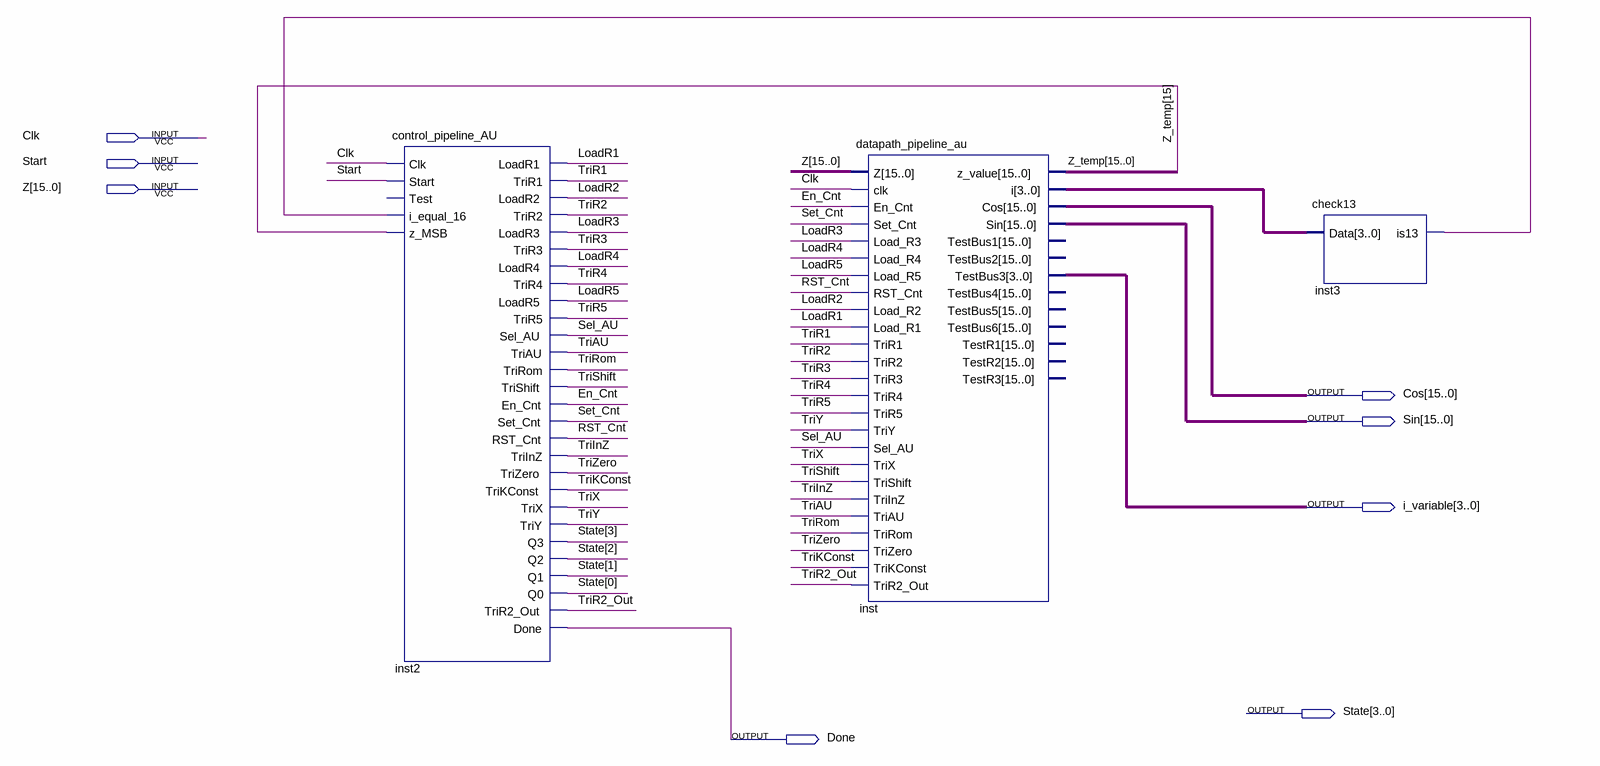
[diagram p0: schematic sheet]
// Quartus schematic CORDIC_ver2_pipeline_AU.bdf as structural Verilog: 3 symbols, 8 pins
module CORDIC_ver2_pipeline_AU (
  input  Clk,
  input  Start,
  input  [15:0] Z,
  output [15:0] Cos,
  output [15:0] Sin,
  output [3:0] i_variable,
  output [3:0] State,
  output Done
);

  wire En_Cnt, inst3_is13, LoadR1, LoadR2, LoadR3, LoadR4, LoadR5, RST_Cnt, Sel_AU, Set_Cnt, TriAU, TriInZ,
       TriKConst, TriR1, TriR2, TriR2_Out, TriR3, TriR4, TriR5, TriRom, TriShift, TriX, TriY, TriZero;
  wire [3:0] inst_i;
  wire [15:0] Z_temp;

  control_pipeline_AU inst2 (
    .Clk(Clk), .Start(Start), .i_equal_16(inst3_is13), .z_MSB(Z_temp[15]), .LoadR1(LoadR1), .TriR1(TriR1),
    .LoadR2(LoadR2), .TriR2(TriR2), .LoadR3(LoadR3), .TriR3(TriR3), .LoadR4(LoadR4), .TriR4(TriR4),
    .LoadR5(LoadR5), .TriR5(TriR5), .Sel_AU(Sel_AU), .TriAU(TriAU), .TriRom(TriRom), .TriShift(TriShift),
    .En_Cnt(En_Cnt), .Set_Cnt(Set_Cnt), .RST_Cnt(RST_Cnt), .TriInZ(TriInZ), .TriZero(TriZero),
    .TriKConst(TriKConst), .TriX(TriX), .TriY(TriY), .Q3(State[3]), .Q2(State[2]), .Q1(State[1]),
    .Q0(State[0]), .TriR2_Out(TriR2_Out), .Done(Done));  // open: Test
  datapath_pipeline_au inst (
    .Z(Z), .clk(Clk), .En_Cnt(En_Cnt), .Set_Cnt(Set_Cnt), .Load_R3(LoadR3), .Load_R4(LoadR4),
    .Load_R5(LoadR5), .RST_Cnt(RST_Cnt), .Load_R2(LoadR2), .Load_R1(LoadR1), .TriR1(TriR1), .TriR2(TriR2),
    .TriR3(TriR3), .TriR4(TriR4), .TriR5(TriR5), .TriY(TriY), .Sel_AU(Sel_AU), .TriX(TriX),
    .TriShift(TriShift), .TriInZ(TriInZ), .TriAU(TriAU), .TriRom(TriRom), .TriZero(TriZero),
    .TriKConst(TriKConst), .TriR2_Out(TriR2_Out), .z_value(Z_temp), .i(inst_i), .Cos(Cos), .Sin(Sin),
    .TestBus3(i_variable));  // open: TestBus1, TestBus2, TestBus4, TestBus5, TestBus6, TestR1, TestR2, TestR3
  check13 inst3 (.Data(inst_i), .is13(inst3_is13));
endmodule
